# Altium schematic sheet Controller-Driver-Sheet-4.SchDoc (part 3 of 3)
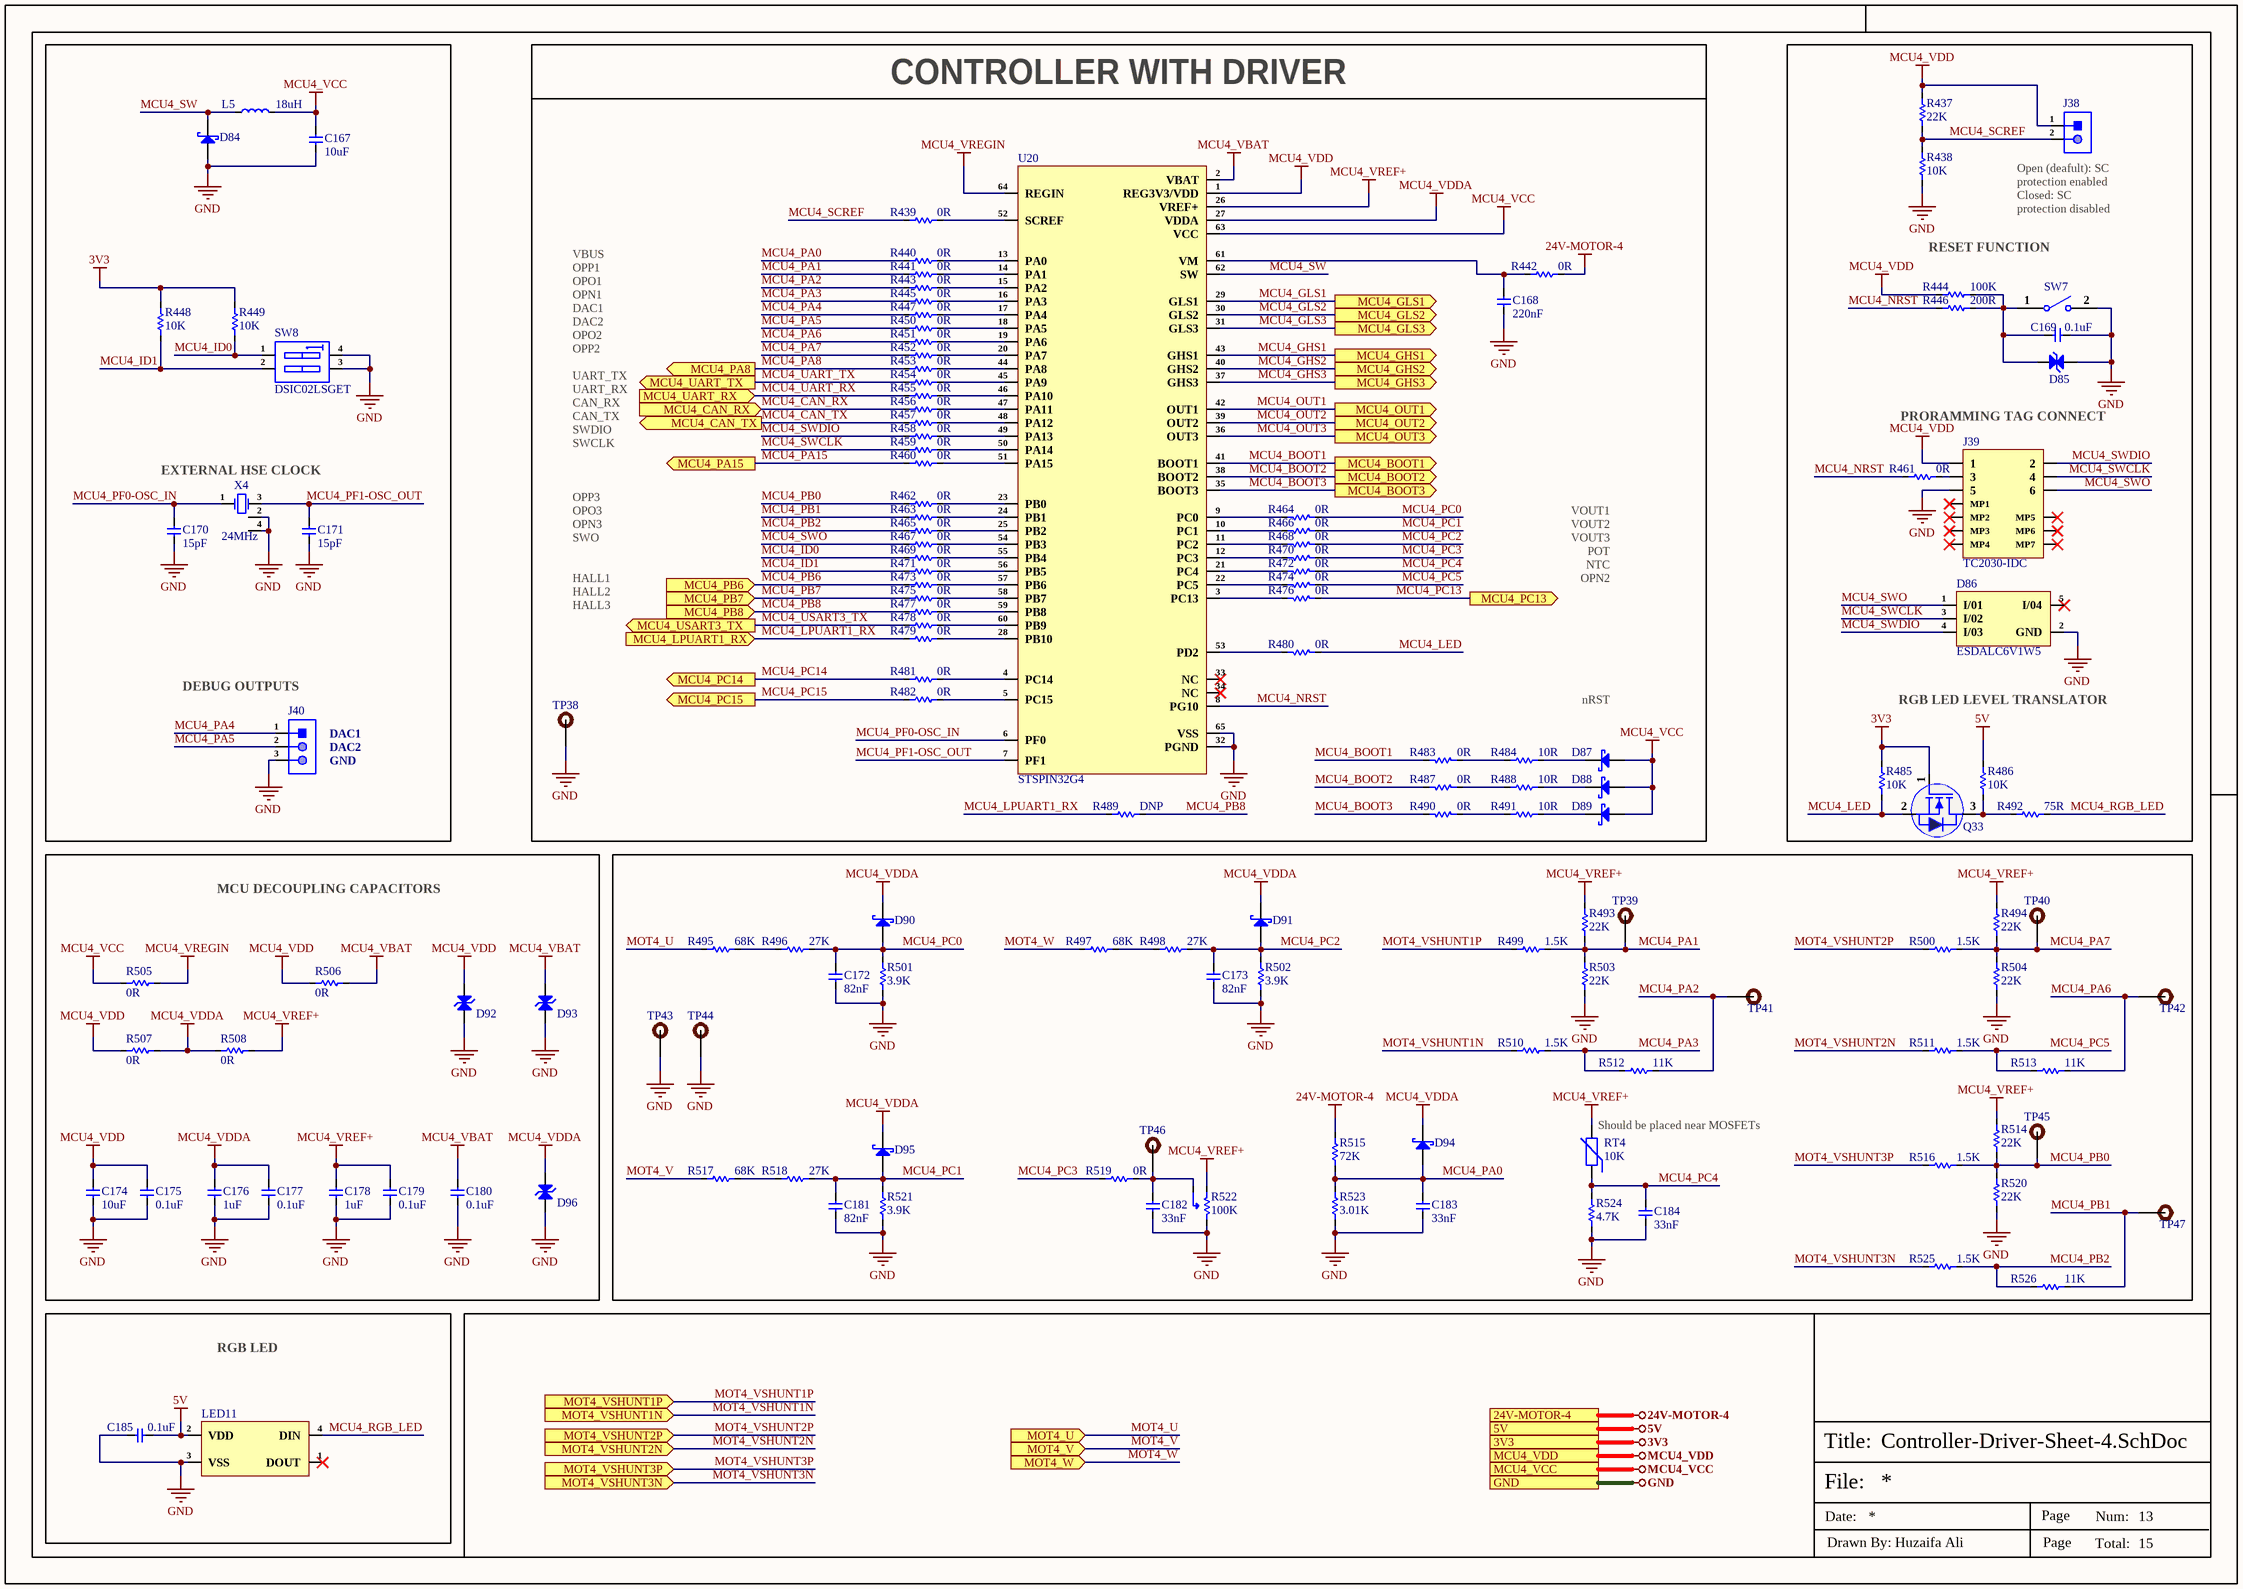
[diagram p2: Controller-Driver-Sheet-4.SchDoc]

## Library data of the parts (continued)
R512 R513 R526 = RC0402FR-0711KL: RES 11K OHM 1% 1/16W 0402; Manufacturer: Yageo; Item Type: Resistors; Power Rating: 63mW; Voltage Rating: 50V; Value: 11kR; Temperature Coefficient: 100ppm/°C; Supplier: Future Electronics; LCSC Part Number: C138063; Manufacturer Part Number: RC0402FR-0711KL; RoHS: Yes; Stock: 350000; Pricing: 10000=0.0018, 100000=0.0011, 150000=0.0017, 300000=0.001, 500000=0.0016, 750000=0.001, 1500000=0.0015, 2000000=0.0009, 5000000=0.0014 (USD); Case/Package: 0402; Pins: 2; Case Code (Metric): 1005; Case Code (Imperial): 0402; Min Operating Temperature: -55°C; Max Operating Temperature: 155°C; Tolerance: 1%; Packaging: Tape and Reel; Package Quantity: 1; Resistor Type: Thick Film; Number of Terminations: 2; Termination: SMD/SMT; Max Power Dissipation: 63mW; Voltage Rating (DC): 50V; Features: Moisture Resistant; Series: RC; Resistance Tolerance: 1%; Length: 0.039inch; Width: 0.02inch; Height: 0.016inch; RoHS Compliant: Yes; Reach SVHC Compliant: No; Lead Free: Lead Free; ComponentLink1URL: https://datasheet.ciiva.com/5999/1018594-5999918.pdf?src-supplier=Farnell; ComponentLink1Description: https://datasheet.ciiva.com/5999/1018594-5999918.pdf?src-supplier=Farnell; ComponentLink2URL: https://datasheet.ciiva.com/2453/pyu-r-int-thick-7-2453641.pdf?src-supplier=Digikey; ComponentLink2Description: https://datasheet.ciiva.com/2453/pyu-r-int-thick-7-2453641.pdf?src-supplier=Digikey; ComponentLink3URL: https://datasheet.ciiva.com/2453/pyu-r-int-thick-7-2453642.pdf?src-supplier=Digikey; ComponentLink3Description: https://datasheet.ciiva.com/2453/pyu-r-int-thick-7-2453642.pdf?src-supplier=Digikey; ComponentLink4URL: https://datasheet.ciiva.com/2453/pyu-r-int-thick-7-2453640.pdf?src-supplier=Digikey; ComponentLink4Description: https://datasheet.ciiva.com/2453/pyu-r-int-thick-7-2453640.pdf?src-supplier=Digikey; ComponentLink5URL: https://datasheet.ciiva.com/12668/pyu-rc0402-51-rohs-l-6-r-12668234.pdf?src-supplier=Mouser; ComponentLink5Description: https://datasheet.ciiva.com/12668/pyu-rc0402-51-rohs-l-6-r-12668234.pdf?src-supplier=Mouser
R515 = AR03BTCX7202N: 62.5mW Thin Film Resistor 50V ±25ppm/℃ ±0.1% 72kΩ 0603 Chip Resistor - Surface Mount ROHS; Manufacturer: Viking Tech; Manufacturer Part Number: AR03BTCX7202N; Package: 0603; LCSC Part Number: C2828635; Item Type: Resistor; ComponentLink1Description: LCSC; ComponentLink1URL: https://www.lcsc.com/product-detail/Chip-Resistor-Surface-Mount_Viking-Tech-AR03BTCX7202N_C2828635.html
R522 = 3386P-1-104TLF: SMD Chip Resistor, 68 kOhm, ï¿½ 1%, 62.5 mW, 0402 [1005 Metric], Thick Film, General Purpose; Manufacturer: BOURNS; Item Type: Potentiometer; Voltage Rating (AC): 300V; Power Rating: 63mW; Temperature Coefficient: 100ppm/°C; Voltage Rating: 50V; Manufacturer Part Number: 3386P-1-104TLF; LCSC Part Number: C116303; ComponentLink1Description: LCSC; ComponentLink1URL: https://www.lcsc.com/product-detail/Potentiometers-Variable-Resistors_BOURNS-3386P-1-104TLF_C116303.html?s_z=n_%203386P-1-104; Value: 100K; Supplier: Digikey; Supplier Part Number: 3386P-502LF-ND; RoHS: Yes; Category: Variable Resistors and Potentiometers; Stock: 3184; Pricing: 1=1.61, 10=1.424, 25=1.2816, 50=1.2342, 100=1.1868, 250=1.11556, 500=0.9494, 1000=0.8782, 5000=0.72154 (USD); Case/Package: 0402; Case Code (Metric): 1005; Case Code (Imperial): 0402; Min Operating Temperature: -55°C; Max Operating Temperature: 155°C; Tolerance: 1%; Series: RC; Package Quantity: 1; Packaging: Tape and Reel; Resistor Type: Thick Film; Number of Terminations: 2; Termination: SMD/SMT; Max Power Dissipation: 63mW; Features: Moisture Resistant; Construction: Rectangular; Resistance Tolerance: 1%; Length: 0.039inch; Width: 0.02inch; Height: 0.016inch; Depth: 0.5mm; RoHS Compliant: Yes; Military Standard: Not; Reach SVHC Compliant: Unknown; Lead Free: 5697LeadFree; ComponentLink2URL: https://datasheet.ciiva.com/2553/pyu-r-int-thick-7-2553216.pdf?src-supplier=Digikey; ComponentLink2Description: https://datasheet.ciiva.com/2553/pyu-r-int-thick-7-2553216.pdf?src-supplier=Digikey; ComponentLink3URL: https://datasheet.ciiva.com/2553/pyu-r-int-thick-7-2553217.pdf?src-supplier=Digikey; ComponentLink3Description: https://datasheet.ciiva.com/2553/pyu-r-int-thick-7-2553217.pdf?src-supplier=Digikey; ComponentLink4URL: https://datasheet.ciiva.com/2553/pyu-r-int-thick-7-2553215.pdf?src-supplier=Digikey; ComponentLink4Description: https://datasheet.ciiva.com/2553/pyu-r-int-thick-7-2553215.pdf?src-supplier=Digikey; ComponentLink5URL: https://datasheet.ciiva.com/7850/1018594-7850072.pdf?src-supplier=Element14; ComponentLink5Description: https://datasheet.ciiva.com/7850/1018594-7850072.pdf?src-supplier=Element14; ComponentLink6URL: https://datasheet.ciiva.com/7850/1018594-7850073.pdf?src-supplier=Element14; ComponentLink6Description: https://datasheet.ciiva.com/7850/1018594-7850073.pdf?src-supplier=Element14; ComponentLink7URL: https://datasheet.ciiva.com/16781/pyu-rc0402-51-rohs-l-6-r-16781001.pdf?src-supplier=Future+Electronics; ComponentLink7Description: https://datasheet.ciiva.com/16781/pyu-rc0402-51-rohs-l-6-r-16781001.pdf?src-supplier=Future+Electronics
R523 = RC0603FR-073K01L: RES 3.01K OHM 1% 1/10W 0603; Manufacturer: Yageo; Item Type: Resistor; Supplier: Future Electronics; Supplier Part Number: 5665591; Manufacturer Part Number: RC0603FR-073K01L; RoHS: Yes; Category: Chip SMD Resistors; Stock: 2450000; Pricing: 5000=0.0014, 50000=0.0013, 200000=0.0012, 625000=0.0012, 2000000=0.0011 (USD); ComponentLink1URL: https://datasheet.ciiva.com/11808/0900766b80f96399-11808271.pdf?src-supplier=Rs; ComponentLink1Description: https://datasheet.ciiva.com/11808/0900766b80f96399-11808271.pdf?src-supplier=Rs; LCSC Part Number: C137732
R524 = RC0402FR-074K7L: RES 4.7K OHM 1% 1/16W 0402; Manufacturer: Yageo; Voltage Rating (DC): 50V; Power Rating: 62.5mW; Resistance: 4.7kR; Temperature Coefficient: 100ppm/°C; Max Power Dissipation: 63mW; Item Type: Resistor; Supplier 1: Avnet; Manufacturer Part Number: RC0402FR-074K7L; RoHS: Yes; Category: Chip SMD Resistors; Stock 1: 2420000; Pricing 1: 10000=0.00085 (USD); Case/Package: 0402; Number of Pins: 2; Case Code (Imperial): 0402; Case Code (Metric): 1005; Size Code: 0402; Min Operating Temperature: -55°C; Max Operating Temperature: 155°C; Tolerance: 1%; Voltage Rating: 50V; Packaging: Tape and Reel; Resistor Type: Thick Film; Termination: SMD/SMT; Features: Moisture Resistant; Series: RC; Number of Terminations: 2; Resistance Tolerance: 1%; Construction: Rectangular; Length: 1mm; Width: 0.5mm; Height: 0.32mm; Depth: 0.5mm; Height - Seated (Max): 0.016inch; RoHS Compliant: Yes; Reach SVHC Compliant: Yes; Military Standard: Not; Lead Free: Lead Free; ComponentLink1URL: https://datasheet.ciiva.com/22661/1686128-22661342.pdf?src-supplier=Element14; ComponentLink1Description: https://datasheet.ciiva.com/22661/1686128-22661342.pdf?src-supplier=Element14; ComponentLink2URL: https://datasheet.ciiva.com/7850/1018594-7850022.pdf?src-supplier=Element14; ComponentLink2Description: https://datasheet.ciiva.com/7850/1018594-7850022.pdf?src-supplier=Element14; ComponentLink3URL: https://datasheet.ciiva.com/7850/1018594-7850023.pdf?src-supplier=Element14; ComponentLink3Description: https://datasheet.ciiva.com/7850/1018594-7850023.pdf?src-supplier=Element14; ComponentLink4URL: https://datasheet.ciiva.com/15215/getdatasheetpartid-328119-15215035.pdf?src-supplier=Verical; ComponentLink4Description: https://datasheet.ciiva.com/15215/getdatasheetpartid-328119-15215035.pdf?src-supplier=Verical; Supplier Part Number 1: RC0402FR-074K7L; LCSC Part Number: C105871
RT4 = NCP18XH103F03RB: THERMISTOR NTC 10KOHM 3380K 0603; Manufacturer: Murata; Manufacturer Series: NCP18; Item Type: Thermistors; Value: 10kR; Tolerance: 1%; Power Rating: 100mW; Current Rating: 310uA; Accuracy: 0.7%; Thermistor Application: TEMPERATURE COMPENSATION; Max Current Rating: 100uA; Voltage Rating: 5V; Supplier: Future Electronics; LCSC Part Number: C13564; Manufacturer Part Number: NCP18XH103F03RB; RoHS: Yes; Stock: 140; Pricing: 1=0.295, 15=0.23, 100=0.184, 400=0.151, 2000=0.113 (USD); Mounting Technology: Surface Mount; Case/Package: 0603; Pins: 2; Case Code (Metric): 1608; Case Code (Imperial): 0603; Terminal Finish: Tin; Package Shape: Rectangular; Min Operating Temperature: -40°C; Max Operating Temperature: 125°C; Packaging: Tape and Reel; Package Quantity: 1; Termination: SMD/SMT; Max Power Dissipation: 100mW; Series: NCP; Resistance Tolerance: 1%; Terminal Placement: Dual; Length: 1.6mm; Height: 0.8mm; Depth: 0.8mm; Radiation Hardening: No; Reach SVHC Compliant: No; RoHS Compliant: Yes; Lead Free: 5697LeadFree; ComponentLink1URL: https://datasheet.ciiva.com/11822/0900766b807f1e39-11822112.pdf?src-supplier=Rs; ComponentLink1Description: https://datasheet.ciiva.com/11822/0900766b807f1e39-11822112.pdf?src-supplier=Rs; ComponentLink2URL: https://datasheet.ciiva.com/4504/r44e-3685-4504704.pdf?src-supplier=Mouser; ComponentLink2Description: https://datasheet.ciiva.com/4504/r44e-3685-4504704.pdf?src-supplier=Mouser; ComponentLink3URL: https://datasheet.ciiva.com/2848/r44e-2848446.pdf?src-supplier=Digikey; ComponentLink3Description: https://datasheet.ciiva.com/2848/r44e-2848446.pdf?src-supplier=Digikey; ComponentLink4URL: https://datasheet.ciiva.com/2848/r44e-2848445.pdf?src-supplier=Digikey; ComponentLink4Description: https://datasheet.ciiva.com/2848/r44e-2848445.pdf?src-supplier=Digikey; ComponentLink5URL: https://datasheet.ciiva.com/2848/r44e-2848447.pdf?src-supplier=Digikey; ComponentLink5Description: https://datasheet.ciiva.com/2848/r44e-2848447.pdf?src-supplier=Digikey; ComponentLink6URL: https://datasheet.ciiva.com/3280/l0770e-3280679.pdf?src-supplier=Avnet; ComponentLink6Description: https://datasheet.ciiva.com/3280/l0770e-3280679.pdf?src-supplier=Avnet; ComponentLink7URL: https://datasheet.ciiva.com/16469/l0770e-16469741.pdf?src-supplier=Future+Electronics; ComponentLink7Description: https://datasheet.ciiva.com/16469/l0770e-16469741.pdf?src-supplier=Future+Electronics; ComponentLink8URL: https://datasheet.ciiva.com/17993/getdatasheetpartid-153236-17993210.pdf?src-supplier=Verical; ComponentLink8Description: https://datasheet.ciiva.com/17993/getdatasheetpartid-153236-17993210.pdf?src-supplier=Verical
SW7 = B3U-1000P: SWITCH TACTILE SPST-NO 0.05A 12V; Manufacturer: Omron; Mechanical Life: 200000Cycles; Operating Force: 1.5N; Throw Configuration: SPST; Current Rating: 50mA; Contact Resistance: 100mR; Illumination Type: Non-Illuminated,Illuminated; Switch Travel: 0.15mm; Switch Function: Off-Mom; Actuator Type: Standard; Actuator Length: 0.4mm; Ratings: Dust Proof,IP40; ComponentLink1URL: http://www.farnell.com/datasheets/60838.pdf?src-supplier=Farnell; ComponentLink1Description: http://www.farnell.com/datasheets/60838.pdf?src-supplier=Farnell; ComponentLink2URL: http://www.farnell.com/datasheets/60838.pdf?src-supplier=Element14; ComponentLink2Description: http://www.farnell.com/datasheets/60838.pdf?src-supplier=Element14; ComponentLink3URL: https://omronfs.omron.com/en_US/ecb/products/pdf/en-b3u.pdf?src-supplier=Digi-Key; ComponentLink3Description: https://omronfs.omron.com/en_US/ecb/products/pdf/en-b3u.pdf?src-supplier=Digi-Key; ComponentLink4URL: http://www.omron.com/ecb/products/pdf/en-b3u.pdf?src-supplier=Digi-Key; ComponentLink4Description: http://www.omron.com/ecb/products/pdf/en-b3u.pdf?src-supplier=Digi-Key; ComponentLink5URL: https://www.distrelec.biz/Web/Downloads/he/et/B3U_eng_datasheet.pdf?mime=application%2Fpdf&src-supplier=Distrelec; ComponentLink5Description: https://www.distrelec.biz/Web/Downloads/he/et/B3U_eng_datasheet.pdf?mime=application%2Fpdf&src-supplier=Distrelec; ComponentLink6URL: http://www.onlinecomponents.com/productFiles/mf-OM/en-b3u.pdf?src-supplier=Onlinecomponents.com; ComponentLink6Description: http://www.onlinecomponents.com/productFiles/mf-OM/en-b3u.pdf?src-supplier=Onlinecomponents.com; Supplier 1: Digi-Key; Manufacturer Part Number: B3U-1000P; Stock 1: 116454; Pricing 1: 1=1, 10=0.961, 25=0.9064, 50=0.7976, 100=0.7251, 250=0.68888, 500=0.67074, 1000=0.52571 (USD); Mount: Surface Mount; Weight: 0.000776oz; Contact Material: Silver; Min Operating Temperature: -25°C; Max Operating Temperature: 70°C; Packaging: Tape and Reel; Voltage Rating (DC): 12V; Package Quantity: 1; Max Current Rating: 50mA; Termination: SMD/SMT; Orientation: Straight; Max Voltage Rating (DC): 12V; Electrical Life: 200000Cycles; Insulation Resistance: 100MR; Contact Current Rating: 50mA; Length: 4mm; Height: 1.2mm; Depth: 2.5mm; Width: 3mm; REACH SVHC: Unknown; Lead Free: Lead Free; ComponentLink7URL: https://www.verical.com/server-webapp/html/getDatasheet?partID=552554&src-supplier=Verical; ComponentLink7Description: https://www.verical.com/server-webapp/html/getDatasheet?partID=552554&src-supplier=Verical; ComponentLink8URL: http://www.farnell.com/datasheets/1685550.pdf?src-supplier=Element14; ComponentLink8Description: http://www.farnell.com/datasheets/1685550.pdf?src-supplier=Element14; ComponentLink9URL: http://www.farnell.com/datasheets/2610940.pdf?src-supplier=Farnell; ComponentLink9Description: http://www.farnell.com/datasheets/2610940.pdf?src-supplier=Farnell; ComponentLink10URL: https://www.alliedelec.com/m/d/4c8a9ef82804fc3c241a13c1e298fd73.pdf?src-supplier=Allied+Electronics; ComponentLink10Description: https://www.alliedelec.com/m/d/4c8a9ef82804fc3c241a13c1e298fd73.pdf?src-supplier=Allied+Electronics; Supplier Part Number 1: SW1020DKR-ND; LCSC Part Number: C231329; Item Type: Switch
SW8 = DSIC02LSGET: 2 positions SPST Black Flat Toggle, Raised Style SMD-4P,5.1x6mm DIP Switches ROHS; Manufacturer: DongGuan; Item Type: Switch; Manufacturer Part Number: DSIC02LSGET; Package: SMD-4P,5.1x6mm; LCSC Part Number: C54949; ComponentLink1Description: LCSC; ComponentLink1URL: https://www.lcsc.com/product-detail/DIP-Switches_DongGuan-KINGTEK-Industrial-Co-LTD-DSIC02LSGET_C54949.html?s_z=n_DSIC02LSGET
TP38-TP47 = TEST POINT: Test Point ON; Item Type: TEST POINT
U20 = STSPIN32G4: 3-PHASE BRUSHLESS MOTOR CONTROLL; Manufacturer: STMicroelectronics; Item Type: IC; Supplier: Mouser; LCSC Part Number: C7434864; Manufacturer Part Number: STSPIN32G4; RoHS: Yes; Stock: 5173; Pricing: 1=7.19, 10=5.61, 50=4.81, 100=4.81, 1000=4.37, 10000=4.37 (USD)
X4 = XL7EL89COI-111YLC-24M: 24MHz Surface Mount Crystal 12pF ±10ppm ±20ppm SMD2016-4P Crystals ROHS; Manufacturer: YXC; Manufacturer Part Number: XL7EL89COI-111YLC-24M; Package: SMD2016-4; LCSC Part Number: C22434877; Item Type: Crystal; ComponentLink1Description: LCSC; ComponentLink1URL: https://www.lcsc.com/product-detail/Crystals_YXC-Crystal-Oscillators-XL7EL89COI-111YLC-24M_C22434877.html